# Altium schematic sheet 40_IMU.SchDoc
size 594 x 420 mm
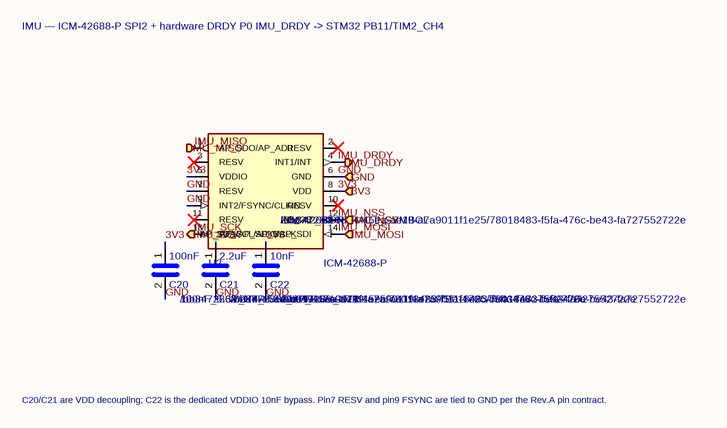
[diagram p0: 40_IMU.SchDoc]

## Parts
C20  hierarchy_path: /bb847286-0d74-45ea-ae19-a7a9011f1e25/78018483-f5fa-476c-be43-fa727552722e  MPN: 100nF_6.3V_X7R  [C_0402_1005Metric]  (hidden comment: 100nF)
C21  hierarchy_path: /bb847286-0d74-45ea-ae19-a7a9011f1e25/78018483-f5fa-476c-be43-fa727552722e  MPN: 2.2uF_6.3V_X7R  [C_0603_1608Metric]  (hidden comment: 2.2uF)
C22  hierarchy_path: /bb847286-0d74-45ea-ae19-a7a9011f1e25/78018483-f5fa-476c-be43-fa727552722e  MPN: 10nF_6.3V_X7R  [C_0402_1005Metric]  (hidden comment: 10nF)
U2  Capture_Status: LOCAL_CONTRACT_SYMBOL  hierarchy_path: /bb847286-0d74-45ea-ae19-a7a9011f1e25/78018483-f5fa-476c-be43-fa727552722e  [ICM-42688-P_LGA14_2.5x3mm_P0.5mm]  (hidden comment: ICM-42688-P)

## Ports
3V3 (in), GND, IMU_DRDY (out), IMU_MISO (out), IMU_MOSI (in), IMU_NSS (in), IMU_SCK (in)

## Nets
3V3: C20.1 C21.1 C22.1 U2.5(VDDIO) U2.8(VDD) ; port 3V3
GND: C20.2 C21.2 C22.2 U2.6(GND) U2.7(RESV) U2.9(INT2/FSYNC/CLKIN) ; port GND
IMU_DRDY: U2.4(INT1/INT) ; port IMU_DRDY
IMU_MISO: U2.1(AP_SDO/AP_AD0) ; port IMU_MISO
IMU_MOSI: U2.14(AP_SDA/AP_SDIO/AP_SDI) ; port IMU_MOSI
IMU_NSS: U2.12(AP_CS) ; port IMU_NSS
IMU_SCK: U2.13(AP_SCL/AP_SCLK) ; port IMU_SCK

Not connected (* = marked no-connect by the designer): U2 2(RESV)* 3(RESV)* 10(RESV)* 11(RESV)*

## Notes on the sheet
- IMU — ICM-42688-P SPI2 + hardware DRDY
  P0 IMU_DRDY -> STM32 PB11/TIM2_CH4
- C20/C21 are VDD decoupling; C22 is the dedicated VDDIO 10nF bypass.
  Pin7 RESV and pin9 FSYNC are tied to GND per the Rev.A pin contract.
- 1
- 2
- 3
- 4
- 5
- 6
- 7
- 8
- 9
- 10
- 11
- A
- B
- C
- D
- E
- F
- G
- H
- Title: EVT_SYS_CARRIER
- File: 40_IMU.kicad_sch
- Sheet: /
- KiCad E.D.A.  kicad (5.1.4)-1
- Size: A2
- Date:
- Rev:
- Id: 1/1

## Library data of the parts
C20-C22 = C
  C20: Value: 100nF; Footprint: Capacitor_SMD:C_0402_1005Metric
  C21: Value: 2.2uF; Footprint: Capacitor_SMD:C_0603_1608Metric
  C22: Value: 10nF; Footprint: Capacitor_SMD:C_0402_1005Metric
U2 = ICM-42688-P: MPN: ICM-42688-P; Value: ICM-42688-P; Footprint: SystemCarrier_Local:ICM-42688-P_LGA14_2.5x3mm_P0.5mm